# Altium schematic sheet S1_MCU.SchDoc
size 420 x 297 mm; ENG_APP_DATE: --/--/--; DSN_APP_DATE: --/--/--; CHK_APP_DATE: --/--/--; ApprovedBy: HITESH; SheetNumber: 1; SheetTotal: 11
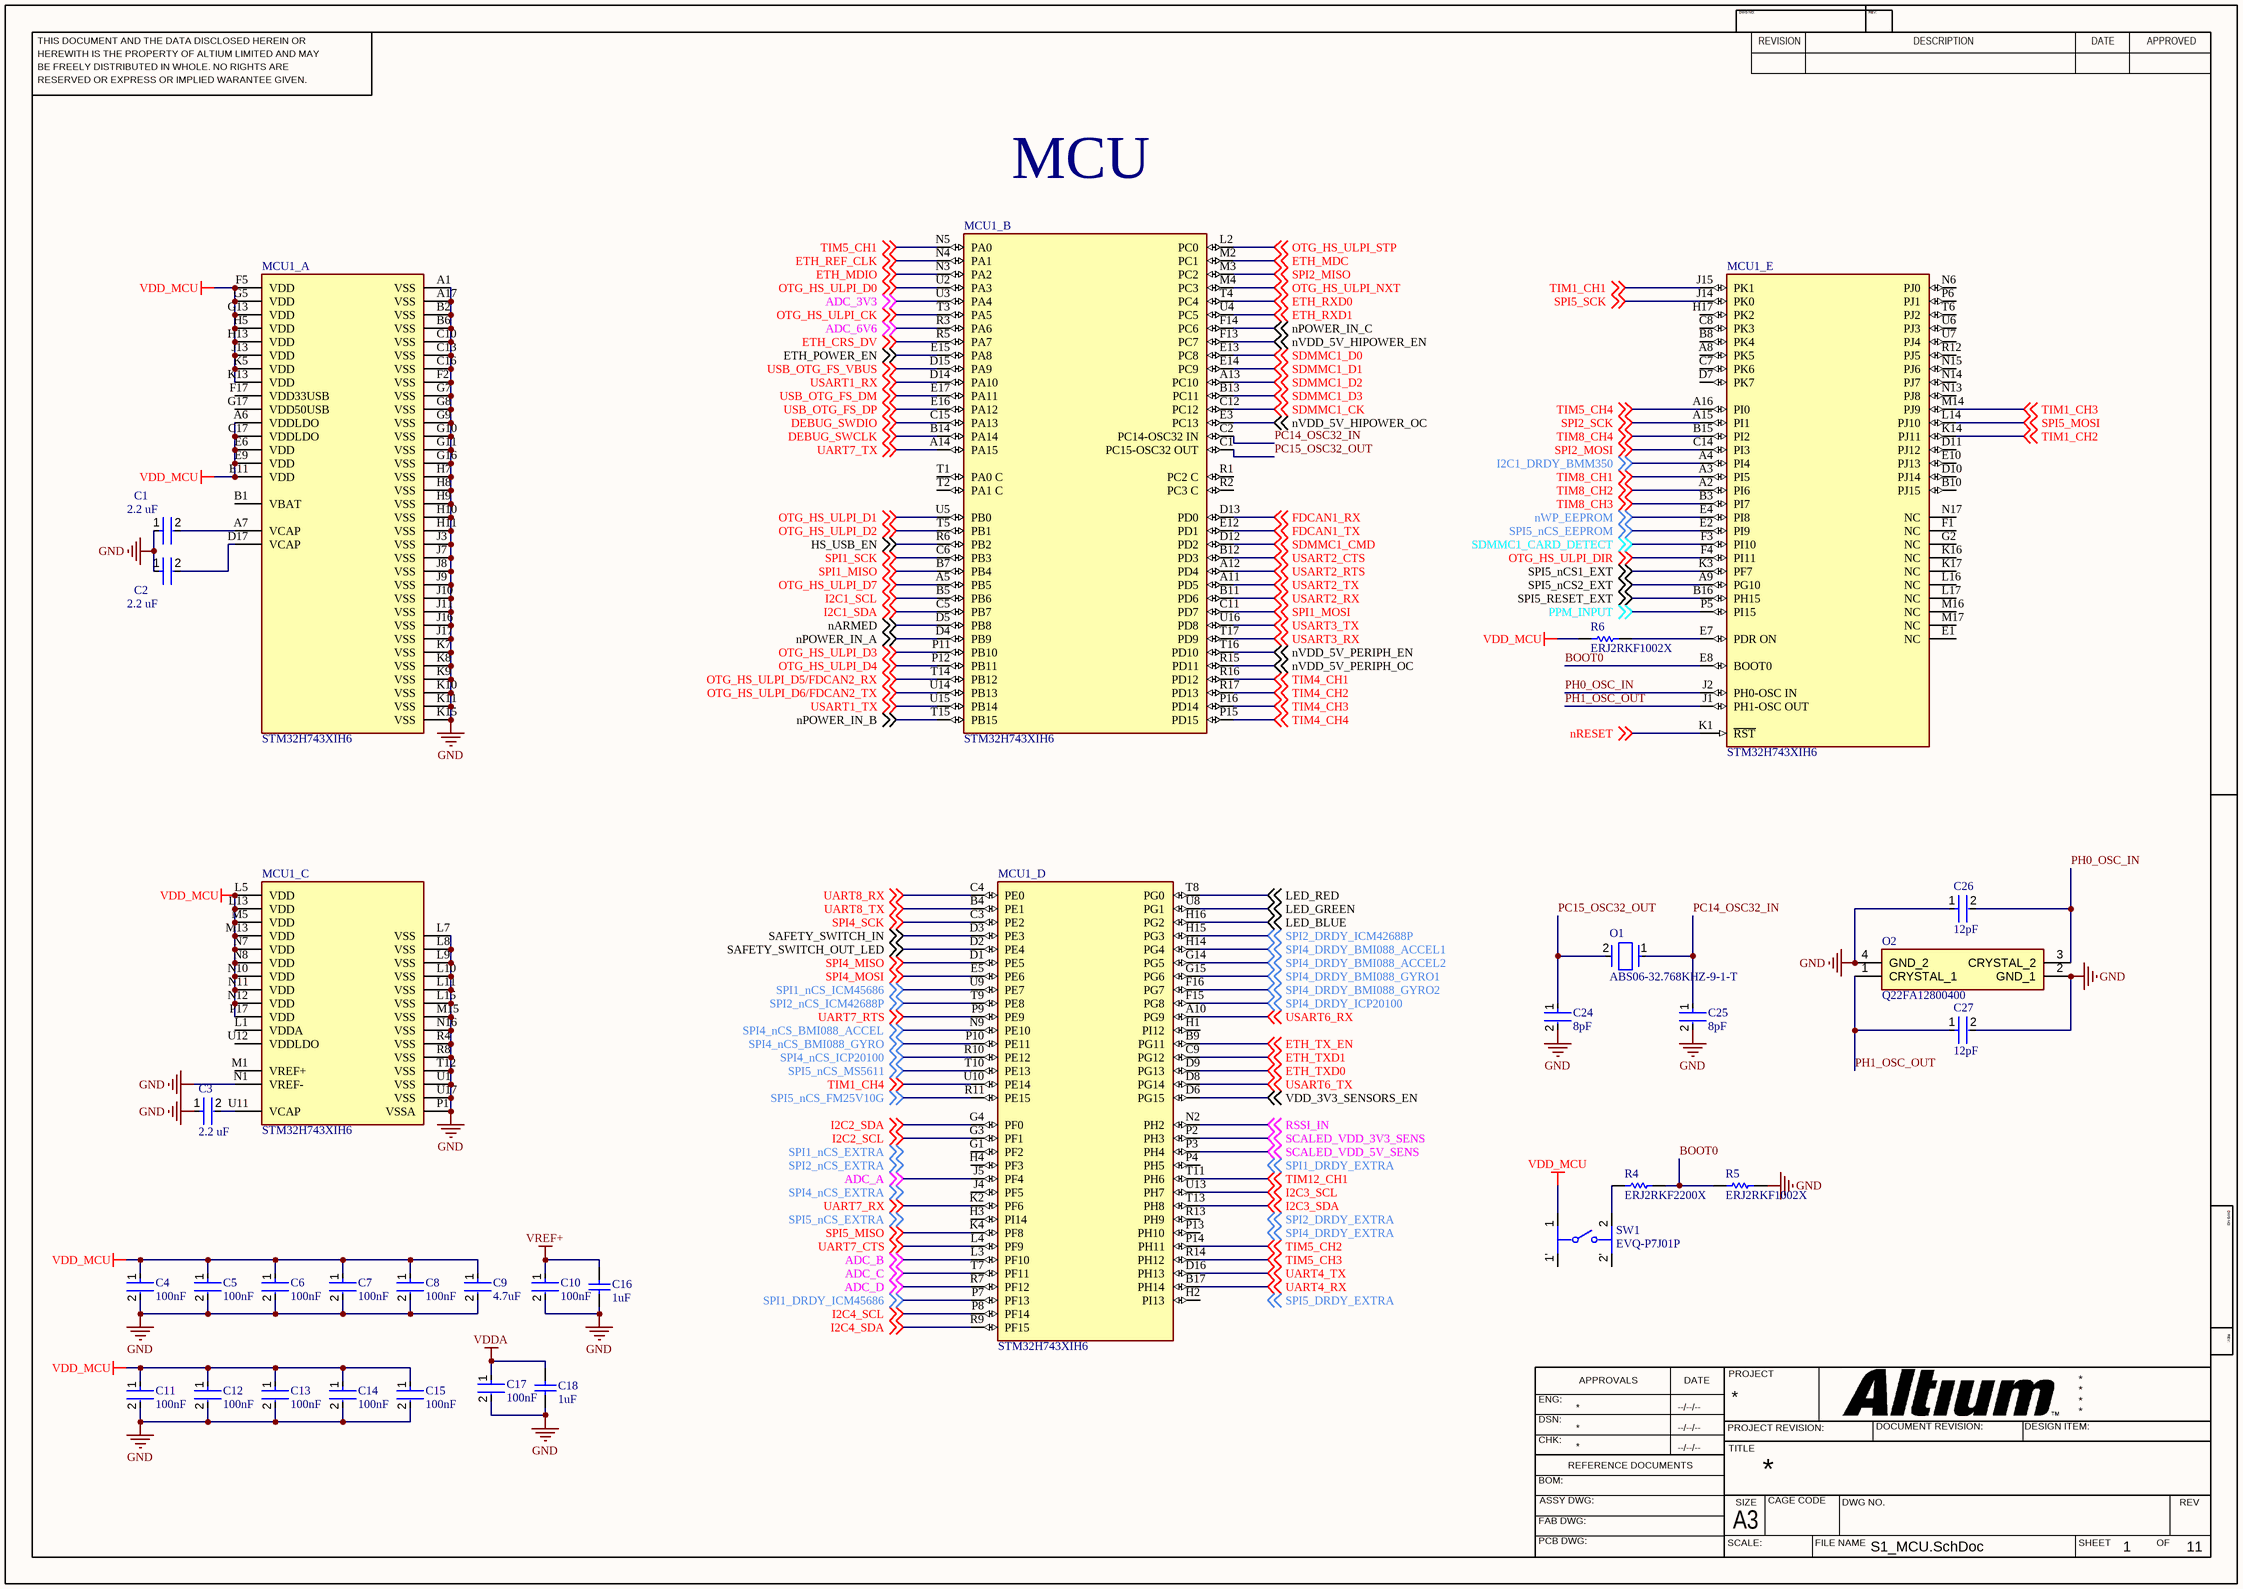
[diagram p0: S1_MCU.SchDoc]

## Parts
C1  2.2 uF  [FP-C1005-050-IPC_A]
C2  2.2 uF  [FP-C1005-050-IPC_A]
C3  2.2 uF  [FP-C1005-050-IPC_A]
C4  100nF  [FP-CC0402-MFG]
C5  100nF  [FP-CC0402-MFG]
C6  100nF  [FP-CC0402-MFG]
C7  100nF  [FP-CC0402-MFG]
C8  100nF  [FP-CC0402-MFG]
C9  4.7uF  [FP-CC0402-MFG]
C10  100nF  [FP-CC0402-MFG]
C11  100nF  [FP-CC0402-MFG]
C12  100nF  [FP-CC0402-MFG]
C13  100nF  [FP-CC0402-MFG]
C14  100nF  [FP-CC0402-MFG]
C15  100nF  [FP-CC0402-MFG]
C16  1uF  [CAPC0402(1005)60_L]
C17  100nF  [FP-CC0402-MFG]
C18  1uF  [CAPC0402(1005)60_L]
C24  8pF  [FP-GJM155-0_05-IPC_C]
C25  8pF  [FP-GJM155-0_05-IPC_C]
C26  12pF  [FP-GRM155-0_05-MFG]
C27  12pF  [FP-GRM155-0_05-MFG]
MCU1_  STM32H743XIH6  [FP-TFBGA240+25-A07U-MFG]  (parts A,B,C,D,E of 5)
O1  ABS06-32.768KHZ-9-1-T  [FP-ABS06-MFG]
O2  Q22FA12800400  [Q22FA12800400]
R4  ERJ2RKF2200X  [RESC1005X40X25LL05T05]
R5  ERJ2RKF1002X  [RESC1005X40X25LL05T05]
R6  ERJ2RKF1002X  [RESC1005X40X25LL05T05]
SW1  EVQ-P7J01P  [FP-EVQ-P7J01P-MFG]

## Nets
GND: C1.1 C2.1 C3.1 C4.2 C5.2 C6.2 C7.2 C8.2 C9.2 C10.2 C11.2 C12.2 C13.2 C14.2 C15.2 C16.2 C17.2 C18.2 C24.2 C25.2 C26.1 C27.2 MCU1_.A1(VSS) MCU1_.A17(VSS) MCU1_.B2(VSS) MCU1_.B6(VSS) MCU1_.C10(VSS) MCU1_.C13(VSS) MCU1_.C16(VSS) MCU1_.F2(VSS) MCU1_.G7(VSS) MCU1_.G8(VSS) MCU1_.G9(VSS) MCU1_.G10(VSS) MCU1_.G11(VSS) MCU1_.G16(VSS) MCU1_.H7(VSS) MCU1_.H8(VSS) MCU1_.H9(VSS) MCU1_.H10(VSS) MCU1_.H11(VSS) MCU1_.J3(VSS) MCU1_.J7(VSS) MCU1_.J8(VSS) MCU1_.J9(VSS) MCU1_.J10(VSS) MCU1_.J11(VSS) MCU1_.J16(VSS) MCU1_.J17(VSS) MCU1_.K7(VSS) MCU1_.K8(VSS) MCU1_.K9(VSS) MCU1_.K10(VSS) MCU1_.K11(VSS) MCU1_.K15(VSS) MCU1_.L7(VSS) MCU1_.L8(VSS) MCU1_.L9(VSS) MCU1_.L10(VSS) MCU1_.L11(VSS) MCU1_.L15(VSS) MCU1_.M15(VSS) MCU1_.N1(VREF-) MCU1_.N16(VSS) MCU1_.P1(VSSA) MCU1_.R4(VSS) MCU1_.R8(VSS) MCU1_.T12(VSS) MCU1_.U1(VSS) MCU1_.U17(VSS) O2.2(GND_1) O2.4(GND_2) R5.1
VDD_MCU: C4.1 C5.1 C6.1 C7.1 C8.1 C9.1 C11.1 C12.1 C13.1 C14.1 C15.1 MCU1_.A6(VDDLDO) MCU1_.C17(VDDLDO) MCU1_.E6(VDD) MCU1_.E9(VDD) MCU1_.E11(VDD) MCU1_.F5(VDD) MCU1_.G5(VDD) MCU1_.G13(VDD) MCU1_.H5(VDD) MCU1_.H13(VDD) MCU1_.J13(VDD) MCU1_.K5(VDD) MCU1_.K13(VDD) MCU1_.L5(VDD) MCU1_.L13(VDD) MCU1_.M5(VDD) MCU1_.M13(VDD) MCU1_.N7(VDD) MCU1_.N8(VDD) MCU1_.N10(VDD) MCU1_.N11(VDD) MCU1_.N12(VDD) MCU1_.P17(VDD) R6.2 SW1.1
VDDA: C17.1 C18.1
VREF+: C10.1 C16.1
ADC_3V3: MCU1_.U3(PA4) ; off-sheet ADC_3V3
ADC_6V6: MCU1_.R3(PA6) ; off-sheet ADC_6V6
ADC_A: MCU1_.J5(PF4) ; off-sheet ADC_A
ADC_B: MCU1_.L3(PF10) ; off-sheet ADC_B
ADC_C: MCU1_.T7(PF11) ; off-sheet ADC_C
ADC_D: MCU1_.R7(PF12) ; off-sheet ADC_D
BOOT0: MCU1_.E8(BOOT0) R4.2 R5.2
DEBUG_SWCLK: MCU1_.B14(PA14) ; off-sheet DEBUG_SWCLK
DEBUG_SWDIO: MCU1_.C15(PA13) ; off-sheet DEBUG_SWDIO
ETH_CRS_DV: MCU1_.R5(PA7) ; off-sheet ETH_CRS_DV
ETH_MDC: MCU1_.M2(PC1) ; off-sheet ETH_MDC
ETH_MDIO: MCU1_.N3(PA2) ; off-sheet ETH_MDIO
ETH_POWER_EN: MCU1_.E15(PA8) ; off-sheet ETH_POWER_EN
ETH_REF_CLK: MCU1_.N4(PA1) ; off-sheet ETH_REF_CLK
ETH_RXD0: MCU1_.T4(PC4) ; off-sheet ETH_RXD0
ETH_RXD1: MCU1_.U4(PC5) ; off-sheet ETH_RXD1
ETH_TX_EN: MCU1_.B9(PG11) ; off-sheet ETH_TX_EN
ETH_TXD0: MCU1_.D9(PG13) ; off-sheet ETH_TXD0
ETH_TXD1: MCU1_.C9(PG12) ; off-sheet ETH_TXD1
FDCAN1_RX: MCU1_.D13(PD0) ; off-sheet FDCAN1_RX
FDCAN1_TX: MCU1_.E12(PD1) ; off-sheet FDCAN1_TX
HS_USB_EN: MCU1_.R6(PB2) ; off-sheet HS_USB_EN
I2C1_DRDY_BMM350: MCU1_.A4(PI4) ; off-sheet I2C1_DRDY_BMM350
I2C1_SCL: MCU1_.B5(PB6) ; off-sheet I2C1_SCL
I2C1_SDA: MCU1_.C5(PB7) ; off-sheet I2C1_SDA
I2C2_SCL: MCU1_.G3(PF1) ; off-sheet I2C2_SCL
I2C2_SDA: MCU1_.G4(PF0) ; off-sheet I2C2_SDA
I2C3_SCL: MCU1_.U13(PH7) ; off-sheet I2C3_SCL
I2C3_SDA: MCU1_.T13(PH8) ; off-sheet I2C3_SDA
I2C4_SCL: MCU1_.P8(PF14) ; off-sheet I2C4_SCL
I2C4_SDA: MCU1_.R9(PF15) ; off-sheet I2C4_SDA
LED_BLUE: MCU1_.H16(PG2) ; off-sheet LED_BLUE
LED_GREEN: MCU1_.U8(PG1) ; off-sheet LED_GREEN
LED_RED: MCU1_.T8(PG0) ; off-sheet LED_RED
nARMED: MCU1_.D5(PB8) ; off-sheet nARMED
nPOWER_IN_A: MCU1_.D4(PB9) ; off-sheet nPOWER_IN_A
nPOWER_IN_B: MCU1_.T15(PB15) ; off-sheet nPOWER_IN_B
nPOWER_IN_C: MCU1_.F14(PC6) ; off-sheet nPOWER_IN_C
nRESET: MCU1_.K1(~{RST}) ; off-sheet nRESET
nVDD_5V_HIPOWER_EN: MCU1_.F13(PC7) ; off-sheet nVDD_5V_HIPOWER_EN
nVDD_5V_HIPOWER_OC: MCU1_.E3(PC13) ; off-sheet nVDD_5V_HIPOWER_OC
nVDD_5V_PERIPH_EN: MCU1_.T16(PD10) ; off-sheet nVDD_5V_PERIPH_EN
nVDD_5V_PERIPH_OC: MCU1_.R15(PD11) ; off-sheet nVDD_5V_PERIPH_OC
nWP_EEPROM: MCU1_.E4(PI8) ; off-sheet nWP_EEPROM
OTG_HS_ULPI_CK: MCU1_.T3(PA5) ; off-sheet OTG_HS_ULPI_CK
OTG_HS_ULPI_D0: MCU1_.U2(PA3) ; off-sheet OTG_HS_ULPI_D0
OTG_HS_ULPI_D1: MCU1_.U5(PB0) ; off-sheet OTG_HS_ULPI_D1
OTG_HS_ULPI_D2: MCU1_.T5(PB1) ; off-sheet OTG_HS_ULPI_D2
OTG_HS_ULPI_D3: MCU1_.P11(PB10) ; off-sheet OTG_HS_ULPI_D3
OTG_HS_ULPI_D4: MCU1_.P12(PB11) ; off-sheet OTG_HS_ULPI_D4
OTG_HS_ULPI_D5/FDCAN2_RX: MCU1_.T14(PB12) ; off-sheet OTG_HS_ULPI_D5/FDCAN2_RX
OTG_HS_ULPI_D6/FDCAN2_TX: MCU1_.U14(PB13) ; off-sheet OTG_HS_ULPI_D6/FDCAN2_TX
OTG_HS_ULPI_D7: MCU1_.A5(PB5) ; off-sheet OTG_HS_ULPI_D7
OTG_HS_ULPI_DIR: MCU1_.F4(PI11) ; off-sheet OTG_HS_ULPI_DIR
OTG_HS_ULPI_NXT: MCU1_.M4(PC3) ; off-sheet OTG_HS_ULPI_NXT
OTG_HS_ULPI_STP: MCU1_.L2(PC0) ; off-sheet OTG_HS_ULPI_STP
PC14_OSC32_IN: C25.1 MCU1_.C2(PC14-OSC32_IN) O1.1
PC15_OSC32_OUT: C24.1 MCU1_.C1(PC15-OSC32_OUT) O1.2
PH0_OSC_IN: C26.2 MCU1_.J2(PH0-OSC_IN) O2.3(CRYSTAL_2)
PH1_OSC_OUT: C27.1 MCU1_.J1(PH1-OSC_OUT) O2.1(CRYSTAL_1)
PPM_INPUT: MCU1_.P5(PI15) ; off-sheet PPM_INPUT
RSSI_IN: MCU1_.N2(PH2) ; off-sheet RSSI_IN
SAFETY_SWITCH_IN: MCU1_.D3(PE3) ; off-sheet SAFETY_SWITCH_IN
SAFETY_SWITCH_OUT_LED: MCU1_.D2(PE4) ; off-sheet SAFETY_SWITCH_OUT_LED
SCALED_VDD_3V3_SENS: MCU1_.P2(PH3) ; off-sheet SCALED_VDD_3V3_SENS
SCALED_VDD_5V_SENS: MCU1_.P3(PH4) ; off-sheet SCALED_VDD_5V_SENS
SDMMC1_CARD_DETECT: MCU1_.F3(PI10) ; off-sheet SDMMC1_CARD_DETECT
SDMMC1_CK: MCU1_.C12(PC12) ; off-sheet SDMMC1_CK
SDMMC1_CMD: MCU1_.D12(PD2) ; off-sheet SDMMC1_CMD
SDMMC1_D0: MCU1_.E13(PC8) ; off-sheet SDMMC1_D0
SDMMC1_D1: MCU1_.E14(PC9) ; off-sheet SDMMC1_D1
SDMMC1_D2: MCU1_.A13(PC10) ; off-sheet SDMMC1_D2
SDMMC1_D3: MCU1_.B13(PC11) ; off-sheet SDMMC1_D3
SPI1_DRDY_ICM45686: MCU1_.P7(PF13) ; off-sheet SPI1_DRDY_ICM45686
SPI1_MISO: MCU1_.B7(PB4) ; off-sheet SPI1_MISO
SPI1_MOSI: MCU1_.C11(PD7) ; off-sheet SPI1_MOSI
SPI1_nCS_ICM45686: MCU1_.U9(PE7) ; off-sheet SPI1_nCS_ICM45686
SPI1_SCK: MCU1_.C6(PB3) ; off-sheet SPI1_SCK
SPI2_DRDY_ICM42688P: MCU1_.H15(PG3) ; off-sheet SPI2_DRDY_ICM42688P
SPI2_MISO: MCU1_.M3(PC2) ; off-sheet SPI2_MISO
SPI2_MOSI: MCU1_.C14(PI3) ; off-sheet SPI2_MOSI
SPI2_nCS_ICM42688P: MCU1_.T9(PE8) ; off-sheet SPI2_nCS_ICM42688P
SPI2_SCK: MCU1_.A15(PI1) ; off-sheet SPI2_SCK
SPI4_DRDY_BMI088_ACCEL1: MCU1_.H14(PG4) ; off-sheet SPI4_DRDY_BMI088_ACCEL1
SPI4_DRDY_BMI088_ACCEL2: MCU1_.G14(PG5) ; off-sheet SPI4_DRDY_BMI088_ACCEL2
SPI4_DRDY_BMI088_GYRO1: MCU1_.G15(PG6) ; off-sheet SPI4_DRDY_BMI088_GYRO1
SPI4_DRDY_BMI088_GYRO2: MCU1_.F16(PG7) ; off-sheet SPI4_DRDY_BMI088_GYRO2
SPI4_DRDY_ICP20100: MCU1_.F15(PG8) ; off-sheet SPI4_DRDY_ICP20100
SPI4_MISO: MCU1_.D1(PE5) ; off-sheet SPI4_MISO
SPI4_MOSI: MCU1_.E5(PE6) ; off-sheet SPI4_MOSI
SPI4_nCS_BMI088_ACCEL: MCU1_.N9(PE10) ; off-sheet SPI4_nCS_BMI088_ACCEL
SPI4_nCS_BMI088_GYRO: MCU1_.P10(PE11) ; off-sheet SPI4_nCS_BMI088_GYRO
SPI4_nCS_ICP20100: MCU1_.R10(PE12) ; off-sheet SPI4_nCS_ICP20100
SPI4_SCK: MCU1_.C3(PE2) ; off-sheet SPI4_SCK
SPI5_MISO: MCU1_.K4(PF8) ; off-sheet SPI5_MISO
SPI5_MOSI: MCU1_.L14(PJ10) ; off-sheet SPI5_MOSI
SPI5_nCS1_EXT: MCU1_.K3(PF7) ; off-sheet SPI5_nCS1_EXT
SPI5_nCS2_EXT: MCU1_.A9(PG10) ; off-sheet SPI5_nCS2_EXT
SPI5_nCS_EEPROM: MCU1_.E2(PI9) ; off-sheet SPI5_nCS_EEPROM
SPI5_nCS_FM25V10G: MCU1_.R11(PE15) ; off-sheet SPI5_nCS_FM25V10G
SPI5_nCS_MS5611: MCU1_.T10(PE13) ; off-sheet SPI5_nCS_MS5611
SPI5_RESET_EXT: MCU1_.B16(PH15) ; off-sheet SPI5_RESET_EXT
SPI5_SCK: MCU1_.J14(PK0) ; off-sheet SPI5_SCK
TIM1_CH1: MCU1_.J15(PK1) ; off-sheet TIM1_CH1
TIM1_CH2: MCU1_.K14(PJ11) ; off-sheet TIM1_CH2
TIM1_CH3: MCU1_.M14(PJ9) ; off-sheet TIM1_CH3
TIM1_CH4: MCU1_.U10(PE14) ; off-sheet TIM1_CH4
TIM4_CH1: MCU1_.R16(PD12) ; off-sheet TIM4_CH1
TIM4_CH2: MCU1_.R17(PD13) ; off-sheet TIM4_CH2
TIM4_CH3: MCU1_.P16(PD14) ; off-sheet TIM4_CH3
TIM4_CH4: MCU1_.P15(PD15) ; off-sheet TIM4_CH4
TIM5_CH1: MCU1_.N5(PA0) ; off-sheet TIM5_CH1
TIM5_CH2: MCU1_.P14(PH11) ; off-sheet TIM5_CH2
TIM5_CH3: MCU1_.R14(PH12) ; off-sheet TIM5_CH3
TIM5_CH4: MCU1_.A16(PI0) ; off-sheet TIM5_CH4
TIM8_CH1: MCU1_.A3(PI5) ; off-sheet TIM8_CH1
TIM8_CH2: MCU1_.A2(PI6) ; off-sheet TIM8_CH2
TIM8_CH3: MCU1_.B3(PI7) ; off-sheet TIM8_CH3
TIM8_CH4: MCU1_.B15(PI2) ; off-sheet TIM8_CH4
TIM12_CH1: MCU1_.T11(PH6) ; off-sheet TIM12_CH1
UART4_RX: MCU1_.B17(PH14) ; off-sheet UART4_RX
UART4_TX: MCU1_.D16(PH13) ; off-sheet UART4_TX
UART7_CTS: MCU1_.L4(PF9) ; off-sheet UART7_CTS
UART7_RTS: MCU1_.P9(PE9) ; off-sheet UART7_RTS
UART7_RX: MCU1_.K2(PF6) ; off-sheet UART7_RX
UART7_TX: MCU1_.A14(PA15) ; off-sheet UART7_TX
UART8_RX: MCU1_.C4(PE0) ; off-sheet UART8_RX
UART8_TX: MCU1_.B4(PE1) ; off-sheet UART8_TX
USART1_RX: MCU1_.D14(PA10) ; off-sheet USART1_RX
USART1_TX: MCU1_.U15(PB14) ; off-sheet USART1_TX
USART2_CTS: MCU1_.B12(PD3) ; off-sheet USART2_CTS
USART2_RTS: MCU1_.A12(PD4) ; off-sheet USART2_RTS
USART2_RX: MCU1_.B11(PD6) ; off-sheet USART2_RX
USART2_TX: MCU1_.A11(PD5) ; off-sheet USART2_TX
USART3_RX: MCU1_.T17(PD9) ; off-sheet USART3_RX
USART3_TX: MCU1_.U16(PD8) ; off-sheet USART3_TX
USART6_RX: MCU1_.A10(PG9) ; off-sheet USART6_RX
USART6_TX: MCU1_.D8(PG14) ; off-sheet USART6_TX
USB_OTG_FS_DM: MCU1_.E17(PA11) ; off-sheet USB_OTG_FS_DM
USB_OTG_FS_DP: MCU1_.E16(PA12) ; off-sheet USB_OTG_FS_DP
USB_OTG_FS_VBUS: MCU1_.D15(PA9) ; off-sheet USB_OTG_FS_VBUS
VDD_3V3_SENSORS_EN: MCU1_.D6(PG15) ; off-sheet VDD_3V3_SENSORS_EN
NetC1_2: C1.2 MCU1_.A7(VCAP)
NetC2_2: C2.2 MCU1_.D17(VCAP)
NetC3_2: C3.2 MCU1_.U11(VCAP)
NetMCU1__E7: MCU1_.E7(PDR_ON) R6.1
NetR4_1: R4.1 SW1.2

Not connected (* = marked no-connect by the designer): MCU1_ A8(PK5) B1(VBAT) B8(PK4) B10(PJ15) C7(PK6) C8(PK3) D7(PK7) D10(PJ14) D11(PJ12) E1(NC) E10(PJ13) F1(NC) F17(VDD33USB) G1(PF2) G2(NC) G17(VDD50USB) H1(PI12) H2(PI13) H3(PI14) H4(PF3) H17(PK2) J4(PF5) K16(NC) K17(NC) L1(VDDA) L16(NC) L17(NC) M1(VREF+) M16(NC) M17(NC) N6(PJ0) N13(PJ8) N14(PJ7) N15(PJ6) N17(NC) P4(PH5) P6(PJ1) P13(PH10) R1(PC2_C) R2(PC3_C) R12(PJ5) R13(PH9) T1(PA0_C) T2(PA1_C) T6(PJ2) U6(PJ3) U7(PJ4) U12(VDDLDO); SW1 1' 2'

## Notes on the sheet
- MCU
- Labels drawn without touching a wire or pin: SPI1_DRDY_EXTRA, SPI1_nCS_EXTRA, SPI2_DRDY_EXTRA, SPI2_nCS_EXTRA, SPI4_DRDY_EXTRA, SPI4_nCS_EXTRA, SPI5_DRDY_EXTRA, SPI5_nCS_EXTRA
- THIS DOCUMENT AND THE DATA DISCLOSED HEREIN OR
- HEREWITH IS THE PROPERTY OF ALTIUM LIMITED AND MAY
- DWG NO:
- REVISION
- REV:
- DESCRIPTION
- DATE
- APPROVED
- BE FREELY DISTRIBUTED IN WHOLE. NO RIGHTS ARE
- RESERVED OR EXPRESS OR IMPLIED WARANTEE GIVEN.
- ENG:
- APPROVALS
- PROJECT
- DSN:
- CHK:
- REFERENCE DOCUMENTS
- PROJECT REVISION:
- TITLE
- DOCUMENT REVISION:
- DESIGN ITEM:
- BOM:
- FAB DWG:
- PCB DWG:
- ASSY DWG:
- SCALE:
- A3
- SIZE
- CAGE CODE
- FILE NAME
- DWG NO.
- SHEET
- OF
- REV

## Library data of the parts
C1-C3 = CMP-08246-004339-1: CAP CER 2.2UF 25V X5R 0402; Dielectric Material: Ceramic; Tolerance: 10%; REACH SVHC: No SVHC; Weight: 2.3E-05oz; Capacitance: 2.2uF; Length: 1mm; RoHS Compliant: Yes; Package Quantity: 1; Voltage Rating (DC): 25V; Dielectric: X5R; Series: C; Voltage Rating: 25V; Case Code (Imperial): 0402; Min Operating Temperature: -55°C; Depth: 0.5mm; Resistor Type: Ceramic; Height: 0.5mm; Width: 0.5mm; Mount: Surface Mount; Case Code (Metric): 1005; Case/Package: 0402; Max Operating Temperature: 85°C; Thickness: 0.022inch; Lead Free: Lead Free; Termination: SMD/SMT; Packaging: Tape and Reel
C4-C8 C10-C15 C17 = CMP-03422-001121-1: CAP CER 0.1UF 16V X7R 0402; Manufacturer: YAGEO; Manufacturer Part Number: CC0402KPX7R7BB104; Material: Ceramic; Temperature Coefficient: 30ppm/°C; Automotive Grade: NA; Tolerance: 0.1; Digikey Description: CAP CER 0.1UF 16V X7R 0402; Temperature Range Low: -55°C; Footprint Url: http://www.yageo.com/exep/pages/download/literatures/UPY-C_GEN_24.pdf; RoHS: TRUE; Device Class L3: Ceramic Capacitors; Temperature Characteristic: X7R; Capacitance: 100 nF; Package: CC0402; Device Class L1: Passive Components; Lead Free: Yes; Temperature Range High: +125°C; Category: Cap; Mouser Description: 0402 0.1 uF 16 V ±10% Tolerance X7R SMT Multilayer Ceramic Capacitor; Voltage Rating: 16 V; Value: 100 nF; ComponentLink2Description: Datasheet; Automotive: No; Octopart: https://octopart.com/cc0402kpx7r7bb104-yageo-21548559; ComponentLink2URL: http://www.yageo.com/documents/recent/UPY-GP_NP0_16V-to-50V_16.pdf; Height: 0.55mm; Device Class L2: Capacitors; Temperature: -55°C to +125°C; Ipc Land Pattern Name: CAPC10050X50
C9 = CMP-1034-02137-2: CAP CER 4.7UF 6.3V X5R 0402; Manufacturer: YAGEO; Manufacturer Part Number: CC0402MRX5R5BB475; Temperature Coefficient: 30ppm/°C; Tolerance: 0.2; Automotive Grade: NA; Material: Ceramic; Automotive: No; Temperature: -55°C to +125°C; Category: Cap; Ipc Land Pattern Name: CAPC10050X50; Digikey Description: CAP CER 4.7UF 6.3V X5R 0402; ComponentLink2Description: Datasheet; Octopart: https://octopart.com/cc0402mrx5r5bb475-yageo-20021081; Mouser Description: Multilayer Ceramic Capacitors MLCC - SMD/SMT 4.7uF 6.3V X5R 20%; Device Class L1: Passive Components; Footprint Url: http://www.yageo.com/exep/pages/download/literatures/UPY-C_GEN_24.pdf; Value: 4.7 uF; Temperature Range High: +125°C; ComponentLink2URL: http://www.yageo.com/documents/recent/UPY-GP_NP0_16V-to-50V_16.pdf; Voltage Rating: 6.3 V; Height: 0.55mm; RoHS: TRUE; Package: CC0402; Device Class L3: Ceramic Capacitors; Temperature Characteristic: X5R; Temperature Range Low: -55°C; Capacitance: 4.7 uF; Device Class L2: Capacitors; Lead Free: Yes
C16 C18 = CMP-1034-02115-1: CAP 1uF 6.3V -20% to +80% 0402 (1005 Metric) Thickness 0.6mm SMD; Case-EIA: 0402; Case-Metric: 1005; Rated Voltage: 6.3 V; Tolerance: -20% to +80%; Technology: SMT; Max Thickness: 0.6 mm; Value: 1uF
C24 C25 = CMP-2008-03759-2: Multi-Layer Ceramic Capacitor 8pF C0G  ±0.25pF 0402 Paper T/R; Voltage Rating (DC): 50V; Termination: SMD/SMT; Dielectric: C0G; Packaging: Tape and Reel; Width: 0.02inch; Thickness: 0.022inch; Case Code (Imperial): 0402; Min Operating Temperature: -55°C; Case Code (Metric): 1005; Voltage Rating: 50V; Capacitance: 8pF; Package Quantity: 1; Lead Free: Lead Free; Max Operating Temperature: 125°C; Mount: Surface Mount; Depth: 0.5mm; Height: 0.5mm; Radiation Hardening: No; Case/Package: 0402; Length: 1mm
C26 C27 = CMP-2008-03945-2: CAP CER 12PF 50V C0G/NP0 0402; Tolerance: 2%; Dielectric: C0G; Material: Ceramic; Termination: SMD/SMT; Mount: Surface Mount; REACH SVHC: No SVHC; Depth: 0.5mm; Case Code (Metric): 1005; Voltage Rating: 50V; Height: 0.5mm; Voltage Rating (DC): 50V; Case Code (Imperial): 0402; Package Quantity: 10000; Construction: Flat; Thickness: 0.022inch; Length: 1mm; Min Operating Temperature: -55°C; Width: 0.5mm; Lead Free: Lead Free; Capacitance: 12pF; Case/Package: 0402; Packaging: Tape and Reel; Series: GRM; Voltage: 50V; Radiation Hardening: No; Max Operating Temperature: 125°C
MCU1_ = CMP-12105-000122-1: IC MCU 32BIT 2MB FLASH TFBGA; Number of I/Os: 168; Core Architecture: ARM; Frequency: 400MHz; Oscillator Type: Internal; Interface: I2C; Peripherals: Brown-out Detect/Reset; Memory Type: FLASH; Packaging: Tray; Min Operating Temperature: -40°C; Max Operating Temperature: 85°C; Memory Size: 2MB; Case/Package: TFBGA; RoHS Compliant: Yes
O1 = CMP-27762-003430-2: Crystal 32.768kHz ±10ppm (Tol) 9pF FUND 90kΩ 2-Pin Mini-CSMD T/R; Series Resistance: 90kR; Series: ABS06; Case/Package: CSMD; Package Quantity: 3000; Load Capacitance: 9pF; Number of Pins: 2; Tolerance: 10ppm; RoHS Compliant: Yes; Depth: 1.2mm; Termination: SMD/SMT; Min Operating Temperature: -40°C; Length: 2mm; Packaging: Tape and Reel; Max Operating Temperature: 85°C; Frequency Tolerance: 10ppm; Width: 1.2mm; ESR (Equivalent Series Resistance): 90kR; Radiation Hardening: No; Frequency: 32.768kHz; REACH SVHC: No SVHC; Mount: Surface Mount; Height: 0.6mm
O2 = Q22FA12800400: Crystal or Oscillator; Manufacturer_Name: Seiko Epson Corporation; Datasheet Link: https://datasheet.lcsc.com/szlcsc/Seiko-Epson-Q22FA12800400_C255875.pdf; Height: 0.5mm; Manufacturer_Part_Number: Q22FA12800400
R4 = CMP-2002-01131-1: Manufacturer: Panasonic; Part Number: ERJ2RKF2200X
R5 R6 = CMP-2000-07588-1: Chip Resistor, 10 KOhm, +/- 1%, 0.1 W, -55 to 155 degC, 0402 (1005 Metric), RoHS, Tape and Reel; Manufacturer: Panasonic; Power Rating: 100mW; Voltage Rating: 50V; Resistance: 10KOhm; Case\/Package: 0402; Temperature Coefficient: 100ppm\/degreesC; RoHSCompliant: True; Lead Free: LeadFree; Package Quantity: 1; Contact Plating: Tin; Length: 1mm; Radiation Hardening: No; REACH SVHC: NoSVHC; Max Operating Temperature: 155degC; Depth: 0.5mm; Case Code (Imperial): 0402; Military Standard: Not; Package Description: 2-Pin Surface Mount Device, Body 1 x 0.5 mm; Termination: SMD/SMT; Case Code (Metric): 1005; Height: 0.35mm; Packaging: TapeandReel; Voltage Rating (DC): 50V; Package Reference: 402; Number of Pins: 2; Tolerance: 1%; Mounting Technology: SurfaceMount; Width: 0.02inch; Mount: SurfaceMount; Datasheet URL: https://industrial.panasonic.com/cdbs/www-data/pdf/RDA0000/AOA0000C304.pdf; Composition: ThickFilm; Datasheet Version: 02/2017; Manufacturer URL: http://www.panasonic.com/; Max Power Dissipation: 100mW; Number of Terminations: 2; Min Operating Temperature: -55degC
SW1 = CMP-05618-000001-1: SWITCH TACTILE SPST-NO 0.05A 12V; Manufacturer: Panasonic; Operating Force: 1.6N; Contact Current Rating: 50mA; Electromechanical Life: 100000Cycles; Contact Resistance: 500mΩ; Height: 1.55mm; Temperature Range Low: -20°C; Device Class L1: Electromechanical; Package: 0; RoHS: TRUE; Category: Switch; ComponentLink2Description: Datasheet; Device Class L2: Switches; Temperature Range High: +70°C; Mount: Surface Mount; Device Class L3: Tactile Switches; Temperature: -20°C to +70°C; Automotive: No; Manufacturer Part Number: EVQ-P7J01P; Mouser Description: Tactile Switches 3.5x2.9mm Right Ang Light Touch Switch; ComponentLink2URL: https://b2b-api.panasonic.eu/file_stream/pids/fileversion/2431; Lead Free: Yes; Octopart: https://octopart.com/evq-p7j01p-panasonic-29917078; Digikey Description: SWITCH TACTILE SPST-NO 0.05A 12V; Voltage Rating Dc: 12V; Throw Configuration: SPST-NO